# Altium schematic sheet MainController4(1).SchDoc
size A4; SheetNumber: 5; SheetTotal: 5
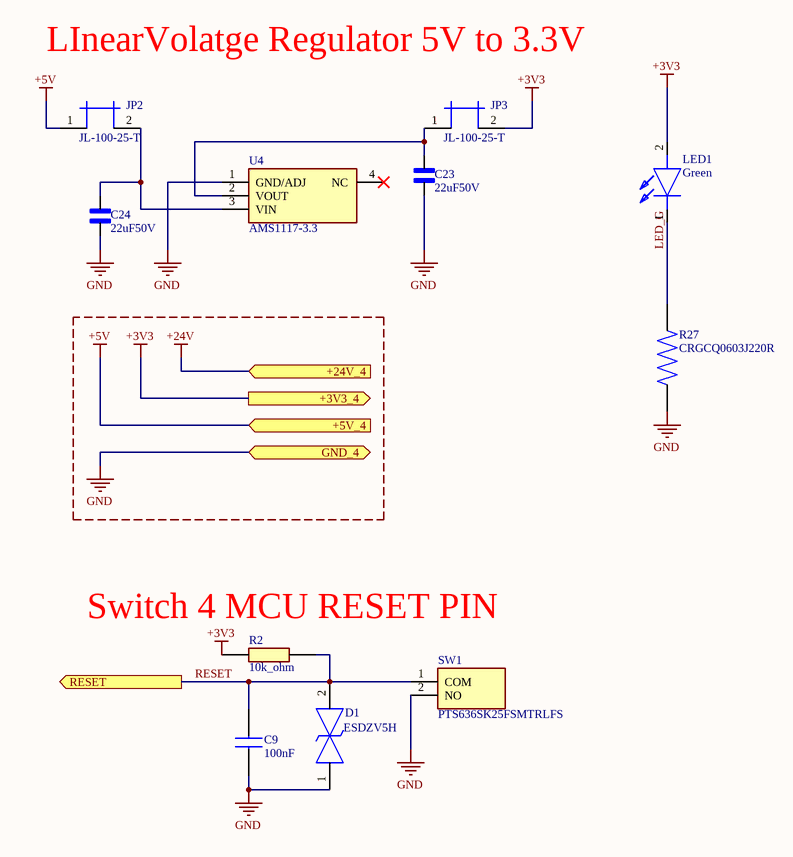
[diagram p0: MainController4(1).SchDoc]

## Parts
C9  100nF  [CAPC1005X55N]
C23  22uF50V  [CAPC6153X390N]
C24  22uF50V  [CAPC6153X390N]
D1  ESDZV5H  [ESDZV5H1BU2]
JP2  JL-100-25-T  [SAMTEC_JL-100-25-T]
JP3  JL-100-25-T  [SAMTEC_JL-100-25-T]
LED1  Green  [LEDC1608X90N]
R2  10k_ohm  [RESC1608X55N]
R27  CRGCQ0603J220R  [RESC1608X55N]
SW1  PTS636SK25FSMTRLFS  [PTS636SK25FSMTRLFS]
U4  AMS1117-3.3  [SOT229P700X180-4N]

## Ports
+3V3_4 (out, see ConnectionMain[3D]), +5V_4 (in, see ConnectionMain[3D]), +24V_4 (in, see ConnectionMain[3C]), GND_4 (bidir, see ConnectionMain[2D]), RESET (out, see ConnectionMain[2C])

## Nets
+3V3: JP3.2 LED1.2(A) R2.2 ; port +3V3_4
+5V: JP2.1 ; port +5V_4
+24V: port +24V_4
GND: C9.1 C23.1 C24.1 D1.1 R27.1 SW1.2(NO) U4.1(GND/ADJ) ; port GND_4
LED_G: LED1.1(K) R27.2
RESET: C9.2 D1.2 R2.1 SW1.1(COM) ; port RESET
NetC23_2: C23.2 JP3.1 U4.2(VOUT)
NetC24_2: C24.2 JP2.2 U4.3(VIN)

Not connected (* = marked no-connect by the designer): U4 4(NC)*

## Notes on the sheet
- LInearVolatge Regulator 5V to 3.3V
- (near R2) Switch 4 MCU RESET PIN

## Library data of the parts
C9 = CL05B104KO5NNNC: Samsung Electro-Mechanics CL05B104KO5NNNC 100nF Multilayer Ceramic Capacitor MLCC 16V dc +/-10% Tolerance SMD; Geometry.Height: 0.55mm; Manufacturer_Name: SAMSUNG; Manufacturer_Part_Number: CL05B104KO5NNNC; Mouser Part Number: 187-CL05B104KO5NNNC; Mouser Price/Stock: https://www.mouser.co.uk/ProductDetail/Samsung-Electro-Mechanics/CL05B104KO5NNNC?qs=hqM3L16%252BxlfT2SKOuAUq6Q%3D%3D; Arrow Part Number: CL05B104KO5NNNC; Arrow Price/Stock: https://www.arrow.com/en/products/cl05b104ko5nnnc/samsung-electro-mechanics.html?utm_currency=USD&region=europe; Datasheet Link: https://datasheet.datasheetarchive.com/originals/distributors/Datasheets-DGA10/2408147.pdf
C23 C24 = KRM55QR71H226KH13K: 22 ÂµF Â±10% 50V Ceramic Capacitor X7R SMD, J-Lead; MF: Murata Electronics; SnapEDA_Link: https://www.snapeda.com/parts/KRM55QR71H226KH13K/Murata/view-part/?ref=snap; Package: None; Value: *; MP: KRM55QR71H226KH13K; Check_prices: https://www.snapeda.com/parts/KRM55QR71H226KH13K/Murata/view-part/?ref=eda
D1 = ESDZV5H-1BU2: Ultra low clamping single line bidirectional ESD protection; Manufacturer_Name: STMicroelectronics; Geometry.Height: 0.27mm; Manufacturer_Part_Number: ESDZV5H-1BU2; Mouser Part Number: 511-ESDZV5H-1BU2; Mouser Price/Stock: https://www.mouser.co.uk/ProductDetail/STMicroelectronics/ESDZV5H-1BU2?qs=YCa%2FAAYMW00tiYJQ%2FjLfEQ%3D%3D; Arrow Part Number: ESDZV5H-1BU2; Arrow Price/Stock: https://www.arrow.com/en/products/esdzv5h-1bu2/stmicroelectronics?utm_currency=USD&region=europe; Datasheet Link: https://www.st.com/resource/en/datasheet/esdzv5h-1bu2.pdf
JP2 JP3 = JL-100-25-T: 2 (1 x 2) Position Shunt Connector White Insulated 0.100" (2.54mm) Silver; Value: *; Price: None; MP: JL-100-25-T; Package: None; Availability: Unavailable
LED1 = LTST-C190GKT: LED; Manufacturer_Name: Lite-On; Datasheet Link: https://media.digikey.com/pdf/Data%20Sheets/Lite-On%20PDFs/LTST-C190GKT.pdf; Height: 0.9mm; Manufacturer_Part_Number: LTST-C190GKT; Mouser Part Number: 859-LTST-C190GKT; Mouser Price/Stock: https://www.mouser.co.uk/ProductDetail/LITEON/LTST-C190GKT?qs=drxkyCeiWgbQzclgbojDOg%3D%3D; Arrow Part Number: LTST-C190GKT; Arrow Price/Stock: https://www.arrow.com/en/products/ltst-c190gkt/lite-on-technology.html?utm_currency=USD&region=nac
R2 = RC0603FR0710KL: YAGEO (PHYCOMP) RC0603 F, 10k OHM, 0.1W; Manufacturer_Name: Yageo Group; Geometry.Height: 0.55mm; Manufacturer_Part_Number: RC0603FR0710KL; Mouser Part Number: *; Mouser Price/Stock: *; Arrow Part Number: RC0603FR0710KL; Arrow Price/Stock: https://www.arrow.com/en/products/rc0603fr-0710kl/yageo; Datasheet Link: http://www.yageo.com/documents/recent/PYu-RC0603_51_RoHS_L_v5.pdf
R27 = CRGCQ0603J220R: Fixed Resistor CRGCQ 0603 220R 5%; MF: TE Connectivity; SnapEDA_Link: https://www.snapeda.com/parts/CRGCQ0603J220R/TE+Connectivity/view-part/?ref=snap; Package: 0603-2 TE Connectivity; Value: *; MP: CRGCQ0603J220R; Check_prices: https://www.snapeda.com/parts/CRGCQ0603J220R/TE+Connectivity/view-part/?ref=eda
SW1 = PTS636SK25FSMTRLFS: PTS636 Series SPST-NO Off-Mom 250 gf Top Actuated SMT Tactile Switch; Manufacturer_Name: LITTELFUSE; Geometry.Height: 2.7mm; Manufacturer_Part_Number: PTS636SK25FSMTRLFS; Mouser Part Number: *; Mouser Price/Stock: *; Arrow Part Number: *; Arrow Price/Stock: *; Datasheet Link: https://www.littelfuse.com/assetdocs/littelfuse-ck-tactile-pts636-series-datasheet?assetguid=8a16fd39-1f87-4545-ab06-9e057a0fe304
U4 = AMS1117-3.3: Integrated Circuit; Manufacturer_Name: Advanced; Datasheet Link: https://datasheet.datasheetarchive.com/originals/distributors/Datasheets-28/DSA-550594.pdf; Height: 1.8mm; Manufacturer_Part_Number: AMS1117-3.3